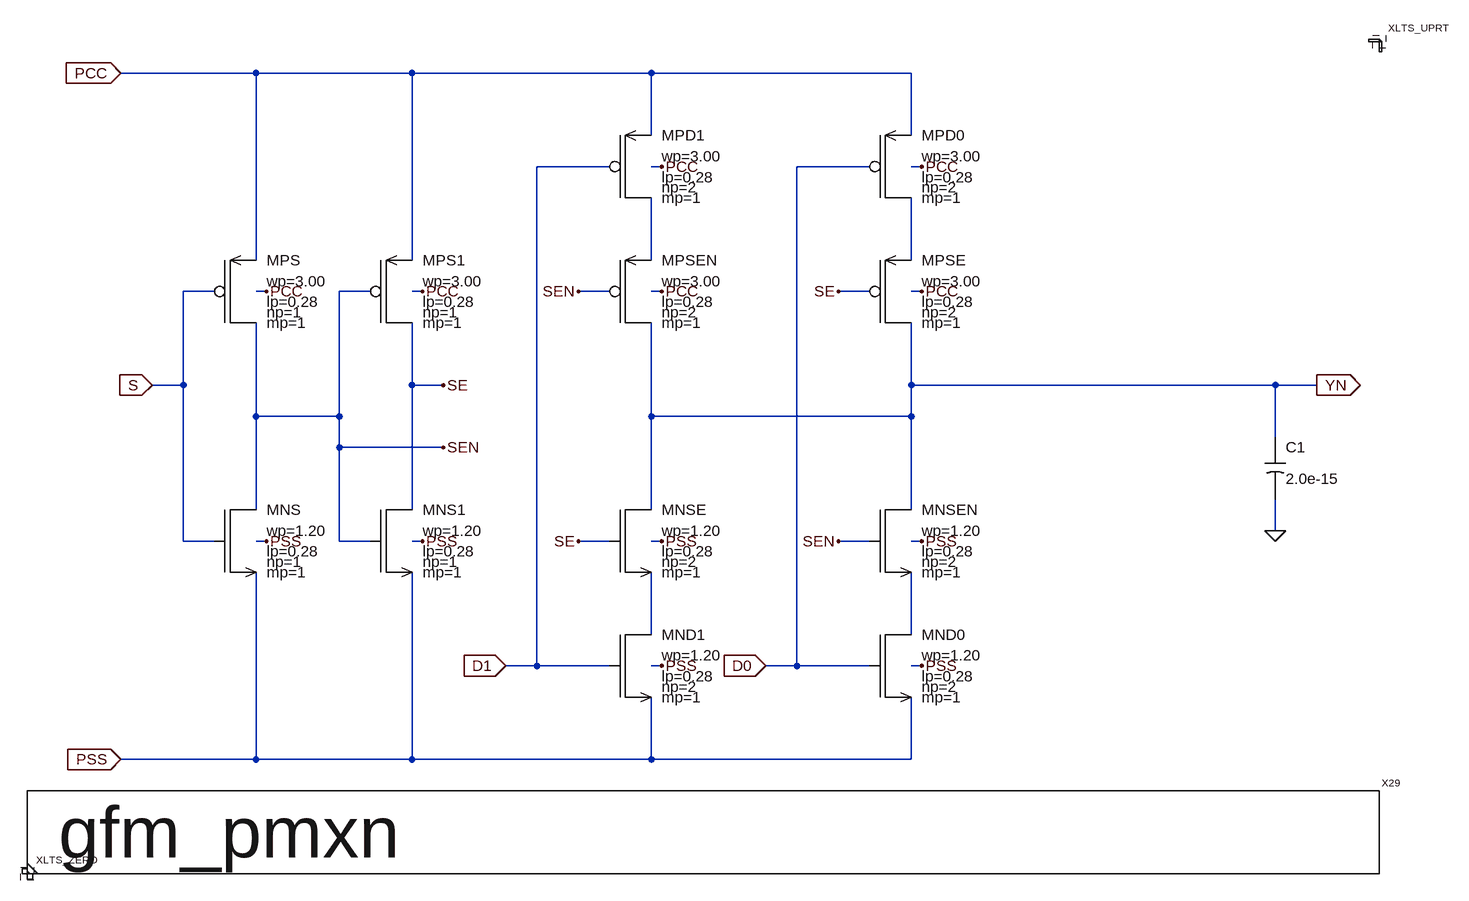
[diagram p0: schematic gfm_pmxn.asc]
gfm_pmxn.asc, the LTspice schematic file:
Version 4
SHEET 1 4552 4336
WIRE 352 -1232 144 -1232
WIRE 592 -1232 352 -1232
WIRE 960 -1232 592 -1232
WIRE 1360 -1232 960 -1232
WIRE 960 -1136 960 -1232
WIRE 1360 -1136 1360 -1232
WIRE 896 -1088 784 -1088
WIRE 976 -1088 960 -1088
WIRE 1296 -1088 1184 -1088
WIRE 1376 -1088 1360 -1088
WIRE 352 -944 352 -1232
WIRE 592 -944 592 -1232
WIRE 960 -944 960 -1040
WIRE 1360 -944 1360 -1040
WIRE 288 -896 240 -896
WIRE 368 -896 352 -896
WIRE 528 -896 480 -896
WIRE 608 -896 592 -896
WIRE 896 -896 848 -896
WIRE 976 -896 960 -896
WIRE 1296 -896 1248 -896
WIRE 1376 -896 1360 -896
WIRE 240 -752 240 -896
WIRE 240 -752 192 -752
WIRE 592 -752 592 -848
WIRE 640 -752 592 -752
WIRE 1360 -752 1360 -848
WIRE 1920 -752 1360 -752
WIRE 1984 -752 1920 -752
WIRE 352 -704 352 -848
WIRE 480 -704 480 -896
WIRE 480 -704 352 -704
WIRE 960 -704 960 -848
WIRE 1360 -704 1360 -752
WIRE 1360 -704 960 -704
WIRE 1920 -672 1920 -752
WIRE 480 -656 480 -704
WIRE 640 -656 480 -656
WIRE 352 -560 352 -704
WIRE 592 -560 592 -752
WIRE 960 -560 960 -704
WIRE 1360 -560 1360 -704
WIRE 1920 -528 1920 -576
WIRE 240 -512 240 -752
WIRE 288 -512 240 -512
WIRE 368 -512 352 -512
WIRE 480 -512 480 -656
WIRE 528 -512 480 -512
WIRE 608 -512 592 -512
WIRE 896 -512 848 -512
WIRE 976 -512 960 -512
WIRE 1296 -512 1248 -512
WIRE 1376 -512 1360 -512
WIRE 960 -368 960 -464
WIRE 1360 -368 1360 -464
WIRE 784 -320 784 -1088
WIRE 784 -320 736 -320
WIRE 896 -320 784 -320
WIRE 976 -320 960 -320
WIRE 1184 -320 1184 -1088
WIRE 1184 -320 1136 -320
WIRE 1296 -320 1184 -320
WIRE 1376 -320 1360 -320
WIRE 352 -176 352 -464
WIRE 352 -176 144 -176
WIRE 592 -176 592 -464
WIRE 592 -176 352 -176
WIRE 960 -176 960 -272
WIRE 960 -176 592 -176
WIRE 1360 -176 1360 -272
WIRE 1360 -176 960 -176
FLAG 144 -176 PSS
IOPIN 144 -176 In
FLAG 144 -1232 PCC
IOPIN 144 -1232 In
FLAG 192 -752 S
IOPIN 192 -752 In
FLAG 736 -320 D1
IOPIN 736 -320 In
FLAG 1136 -320 D0
IOPIN 1136 -320 In
FLAG 1984 -752 YN
IOPIN 1984 -752 Out
FLAG 1920 -528 0
FLAG 1376 -512 PSS
FLAG 1248 -512 SEN
FLAG 976 -512 PSS
FLAG 848 -512 SE
FLAG 1376 -896 PCC
FLAG 1248 -896 SE
FLAG 976 -896 PCC
FLAG 848 -896 SEN
FLAG 1376 -1088 PCC
FLAG 976 -1088 PCC
FLAG 1376 -320 PSS
FLAG 976 -320 PSS
FLAG 368 -512 PSS
FLAG 368 -896 PCC
FLAG 608 -512 PSS
FLAG 608 -896 PCC
FLAG 640 -752 SE
FLAG 640 -656 SEN
SYMBOL gfmcu_nmos3p3 896 -512 R0
SYMATTR InstName MNSE
SYMATTR SpiceLine np=2
SYMATTR Value wp=1.20
SYMATTR Value2 lp=0.28
SYMBOL gfmcu_nmos3p3 896 -320 R0
SYMATTR InstName MND1
SYMATTR SpiceLine np=2
SYMATTR Value wp=1.20
SYMATTR Value2 lp=0.28
SYMBOL gcap 1920 -672 R0
SYMATTR InstName C1
SYMATTR Value 2.0e-15
SYMBOL gfmcu_pmos3p3 1296 -896 R0
SYMATTR InstName MPSE
SYMATTR SpiceLine np=2
SYMATTR Value wp=3.00
SYMATTR Value2 lp=0.28
SYMBOL gfmcu_pmos3p3 1296 -1088 R0
SYMATTR InstName MPD0
SYMATTR SpiceLine np=2
SYMATTR Value wp=3.00
SYMATTR Value2 lp=0.28
SYMBOL gfmcu_pmos3p3 896 -896 R0
SYMATTR InstName MPSEN
SYMATTR SpiceLine np=2
SYMATTR Value wp=3.00
SYMATTR Value2 lp=0.28
SYMBOL gfmcu_pmos3p3 896 -1088 R0
SYMATTR InstName MPD1
SYMATTR SpiceLine np=2
SYMATTR Value wp=3.00
SYMATTR Value2 lp=0.28
SYMBOL BD_GTitleLTS 0 0 R0
SYMATTR InstName X29
SYMATTR SpiceModel gfm_pmxn
SYMBOL gfmcu_nmos3p3 1296 -512 R0
SYMATTR InstName MNSEN
SYMATTR SpiceLine np=2
SYMATTR Value wp=1.20
SYMATTR Value2 lp=0.28
SYMBOL gfmcu_nmos3p3 1296 -320 R0
SYMATTR InstName MND0
SYMATTR SpiceLine np=2
SYMATTR Value wp=1.20
SYMATTR Value2 lp=0.28
SYMBOL gfmcu_nmos3p3 288 -512 R0
SYMATTR InstName MNS
SYMATTR Value wp=1.20
SYMATTR Value2 lp=0.28
SYMBOL gfmcu_pmos3p3 288 -896 R0
SYMATTR InstName MPS
SYMATTR Value wp=3.00
SYMATTR Value2 lp=0.28
SYMBOL gfmcu_nmos3p3 528 -512 R0
SYMATTR InstName MNS1
SYMATTR Value wp=1.20
SYMATTR Value2 lp=0.28
SYMBOL gfmcu_pmos3p3 528 -896 R0
SYMATTR InstName MPS1
SYMATTR Value wp=3.00
SYMATTR Value2 lp=0.28
SYMBOL BD_ZERO 0 0 R0
SYMATTR InstName XLTS_ZERO
SYMBOL BD_UPRT 2080 -1280 R0
SYMATTR InstName XLTS_UPRT

The netlist it stands for:
* gfm_pmxn.asc
XMNSE YN SE N003 PSS gfmcu_nmos3p3 wp=1.20 lp=0.28 np=2 mp=1  ; pins ND NG NS NB
XMND1 N003 D1 PSS PSS gfmcu_nmos3p3 wp=1.20 lp=0.28 np=2 mp=1  ; pins ND NG NS NB
C1 YN 0 2.0e-15
XMPSE YN SE N002 PCC gfmcu_pmos3p3 wp=3.00 lp=0.28 np=2 mp=1  ; pins ND NG NS NB
XMPD0 N002 D0 PCC PCC gfmcu_pmos3p3 wp=3.00 lp=0.28 np=2 mp=1  ; pins ND NG NS NB
XMPSEN YN SEN N001 PCC gfmcu_pmos3p3 wp=3.00 lp=0.28 np=2 mp=1  ; pins ND NG NS NB
XMPD1 N001 D1 PCC PCC gfmcu_pmos3p3 wp=3.00 lp=0.28 np=2 mp=1  ; pins ND NG NS NB
XX29 BD_GTitleLTS
XMNSEN YN SEN N004 PSS gfmcu_nmos3p3 wp=1.20 lp=0.28 np=2 mp=1  ; pins ND NG NS NB
XMND0 N004 D0 PSS PSS gfmcu_nmos3p3 wp=1.20 lp=0.28 np=2 mp=1  ; pins ND NG NS NB
XMNS SEN S PSS PSS gfmcu_nmos3p3 wp=1.20 lp=0.28 np=1 mp=1  ; pins ND NG NS NB
XMPS SEN S PCC PCC gfmcu_pmos3p3 wp=3.00 lp=0.28 np=1 mp=1  ; pins ND NG NS NB
XMNS1 SE SEN PSS PSS gfmcu_nmos3p3 wp=1.20 lp=0.28 np=1 mp=1  ; pins ND NG NS NB
XMPS1 SE SEN PCC PCC gfmcu_pmos3p3 wp=3.00 lp=0.28 np=1 mp=1  ; pins ND NG NS NB
XXLTS_ZERO BD_ZERO
XXLTS_UPRT BD_UPRT
.lib models_gfmcu.lib
.lib dmodels_analog.lib
.backanno
.end